# Altium schematic sheet push-button-switch-1.SchDoc
size A4; SheetNumber: 1; SheetTotal: 17
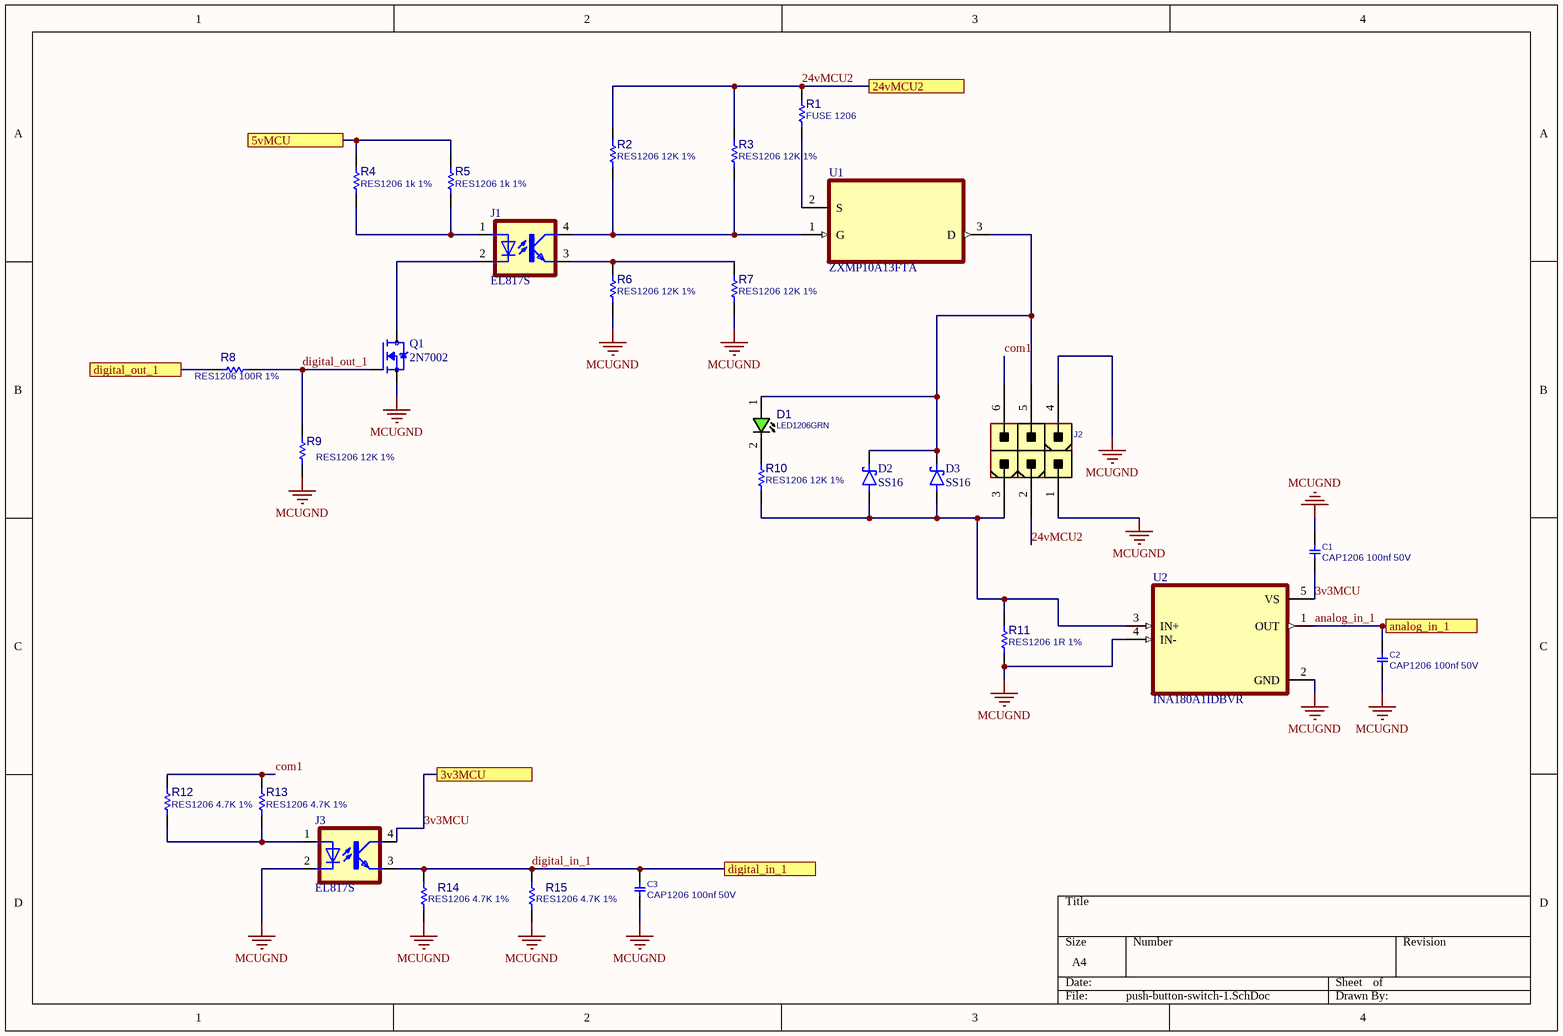
[diagram p0: push-button-switch-1.SchDoc]

## Parts
C1  CAP1206 100nf 50V  [C1206]
C2  CAP1206 100nf 50V  [C1206]
C3  CAP1206 100nf 50V  [C1206]
D1  LED1206GRN  [LED1206GRN]
D2  SS16  [DIOM4325X250N]
D3  SS16  [DIOM4325X250N]
J1  EL817S  [SOIC254P1030X460-4N]
J2  CONN_ATXPWR_6  [ATXPWR_6]  (value not drawn)
J3  EL817S  [SOIC254P1030X460-4N]
Q1  2N7002  [SOT95P240X111-3N]
R1  FUSE 1206  [R1206]
R2  RES1206 12K 1%  [R1206]
R3  RES1206 12K 1%  [R1206]
R4  RES1206 1k 1%  [R1206]
R5  RES1206 1k 1%  [R1206]
R6  RES1206 12K 1%  [R1206]
R7  RES1206 12K 1%  [R1206]
R8  RES1206 100R 1%  [R1206]
R9  RES1206 12K 1%  [R1206]
R10  RES1206 12K 1%  [R1206]
R11  RES1206 1R 1%  [R1206]
R12  RES1206 4.7K 1%  [R1206]
R13  RES1206 4.7K 1%  [R1206]
R14  RES1206 4.7K 1%  [R1206]
R15  RES1206 4.7K 1%  [R1206]
U1  ZXMP10A13FTA  [SOT95P230X110-3N]
U2  INA180A1IDBVR  [SOT95P280X145-5N]

## Ports
3v3MCU, 5vMCU, 24vMCU2, analog_in_1, digital_in_1, digital_out_1

## Nets
MCUGND: C1.1 C2.2 C3.2 J2.1 J2.4 J3.2(C) Q1.2(S) R6.2 R7.2 R9.2 R11.2 R14.1 R15.1 U2.2(GND) U2.4(IN-)
3v3MCU: C1.2 J3.4(COL) U2.5(VS) ; port 3v3MCU
5vMCU: R4.2 R5.2 ; port 5vMCU
24vMCU2: J2.2 R1.1 R2.1 R3.1 ; port 24vMCU2
analog_in_1: C2.1 U2.1(OUT) ; port analog_in_1
com1: J2.6 R12.2 R13.2
digital_in_1: C3.1 J3.3(EMIT) R14.2 R15.2 ; port digital_in_1
digital_out_1: Q1.1(G) R8.2 R9.1
digital_out_1: R8.1 ; port digital_out_1  [a separate net that carries the same name]
NetD1_1: D1.1(ANODE) D2.C(K) D3.C(K) J2.5 U1.3(D)
NetD1_2: D1.2(CATHODE) R10.1
NetD2_A: D2.A D3.A J2.3 R10.2 R11.1 U2.3(IN+)
NetJ1_1: J1.1(A) R4.1 R5.1
NetJ1_2: J1.2(C) Q1.3(D)
NetJ1_3: J1.3(EMIT) R6.1 R7.1
NetJ1_4: J1.4(COL) R2.2 R3.2 U1.1(G)
NetJ3_1: J3.1(A) R12.1 R13.1
NetR1_2: R1.2 U1.2(S)

## Library data of the parts
C1-C3 = CAP_SMD_MLCC_1206: CAP, MLCC; PARAM: -, -%; MANF_P#: MANF_PART#; PARAM2: -V; PRICE: 100= 1$; MANF: -; ASSEMBLY: ASSEMBLY
D1 = LED_SMD_1206_GRN: LED, SMD, 1206, GREEN; PARAM: 20mA; DESC: DESCRIPTION; PARAM2: 2.2V; MANF: -; ASSEMBLY: ASSEMBLY; PRICE: 36t@Javan; MANF_P#: -; VALUE: LED1206GRN; MountType: SMT; PartType: LED
D2 D3 = SS14: 1A, 40V, Schottky Rectifier; MF: Taiwan Semiconductor; SnapEDA_Link: https://www.snapeda.com/parts/SS14/taiwan/view-part/?ref=snap; Package: SMA-2 Taiwan Semiconductor; Value: *; MP: SS14; Check_prices: https://www.snapeda.com/parts/SS14/taiwan/view-part/?ref=eda
J1 J3 = EL817S: Optoisolator Transistor Output 5000Vrms 1 Channel 4-SMD; MF: Everlight Electronics; SnapEDA_Link: https://www.snapeda.com/parts/EL817S/Everlight+Electronics+Co+Ltd/view-part/?ref=snap; Package: SMD-4 Everlight Electronics Co Ltd; Value: *; MP: EL817S; Check_prices: https://www.snapeda.com/parts/EL817S/Everlight+Electronics+Co+Ltd/view-part/?ref=eda
J2 = CONN_ATXPWR_6: CONN, ATX POWER, 6 P; MANF: TE; MANF_P#: 4-1775099-1; VALUE: CONN_ATXPWR_6; MountType: THD; PACKAGE: ATXPWR-6pin; Part Type: Conn.
Q1 = 2N7002: N-Channel 60V 280mA (Ta) 350mW (Ta) Surface Mount SOT-23-3 (TO-236); MF: {'manufacturer': u'onsemi'}; Package: None; Price: None; Value: *; MP: 2N7002; Availability: Unavailable
R1-R15 = RES_SMD_1206: RESISTOR, SMD; PARAM: 1%, 0.25W; DESC: DESCRIPTION; DIST#: MOUSER; MANF_P#: -; MANF: -; ASSEMBLY: ASSEMBLY; PRICE: -; PARAM2: -
U1 = ZXMP10A13FTA: P-Channel 100 V 600mA (Ta) 625mW (Ta) Surface Mount SOT-23-3; MF: Diodes Inc.; Purchase-URL: https://pricing.snapeda.com/search/part/ZXMP10A13FTA/?ref=eda; Package: SOT-23-3 Diodes Inc.; SnapEDA_Link: https://www.snapeda.com/parts/ZXMP10A13FTA/Diodes+Inc./view-part/?ref=snap; Availability: In Stock; Value: *; MP: ZXMP10A13FTA; Check_prices: https://www.snapeda.com/parts/ZXMP10A13FTA/Diodes+Inc./view-part/?ref=eda; Price: None
U2 = INA180A1IDBVR: 26V, 350kHz current sense amplifier; MF: Texas Instruments; SnapEDA_Link: https://www.snapeda.com/parts/INA180A1IDBVR/Texas+Instruments/view-part/?ref=snap; Package: SOT-23-5 Texas Instruments; Value: *; MP: INA180A1IDBVR; Check_prices: https://www.snapeda.com/parts/INA180A1IDBVR/Texas+Instruments/view-part/?ref=eda